# Altium schematic sheet Debugging LED.SchDoc
size A; SheetNumber: 5; SheetTotal: 9
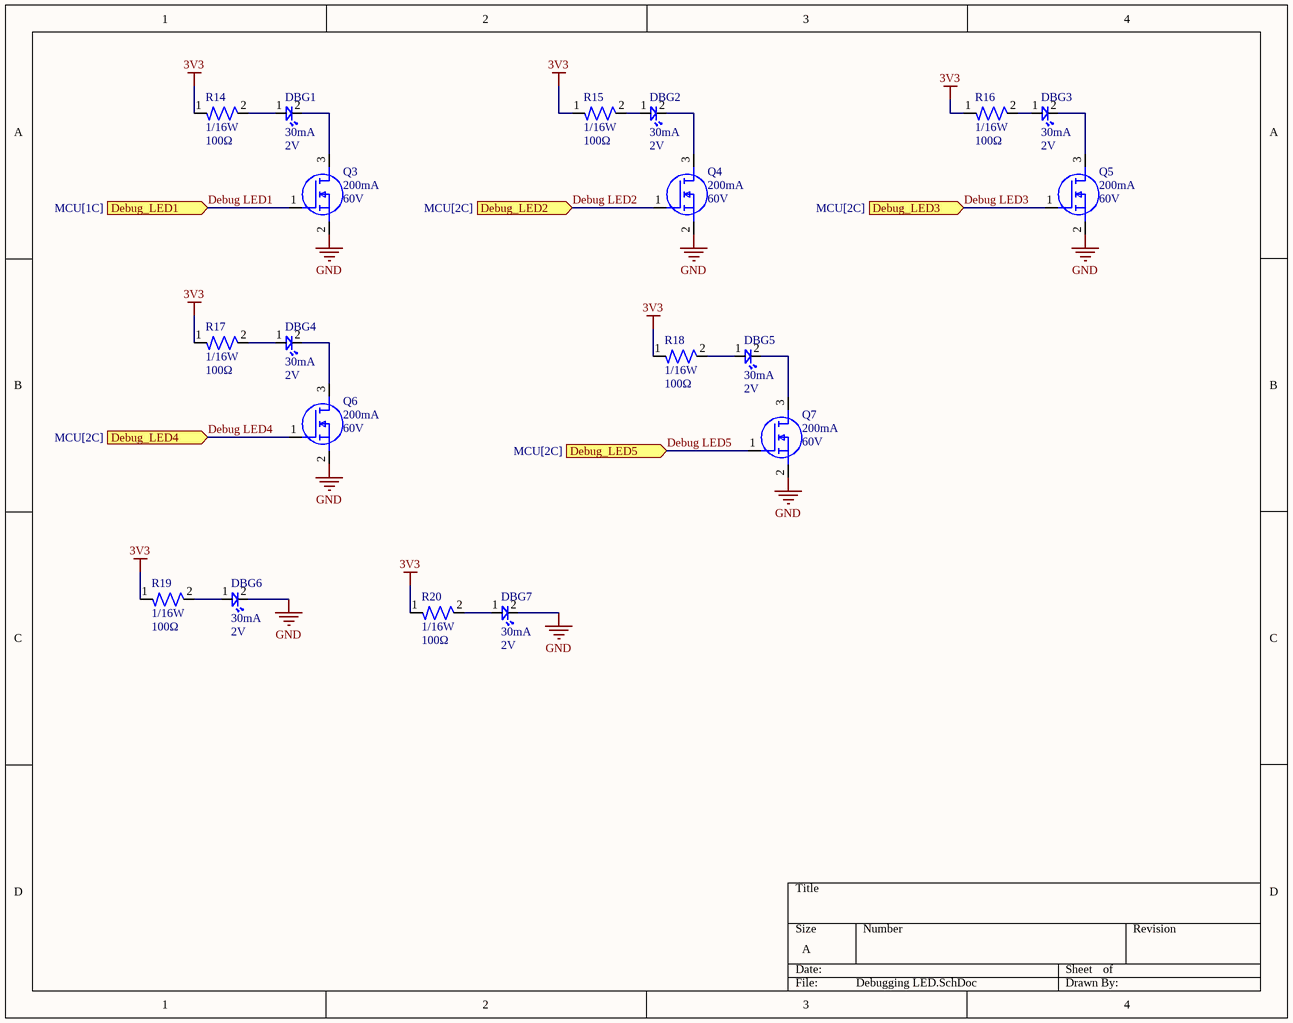
[diagram p0: Debugging LED.SchDoc]

## Parts
DBG1  Forward Current: 30mA  Forward Voltage: 2V  [LED-0603]  (hidden comment: BL-HKC36G-AV-TRB)
DBG2  Forward Current: 30mA  Forward Voltage: 2V  [LED-0603]  (hidden comment: BL-HKC36G-AV-TRB)
DBG3  Forward Current: 30mA  Forward Voltage: 2V  [LED-0603]  (hidden comment: BL-HKC36G-AV-TRB)
DBG4  Forward Current: 30mA  Forward Voltage: 2V  [LED-0603]  (hidden comment: BL-HKC36G-AV-TRB)
DBG5  Forward Current: 30mA  Forward Voltage: 2V  [LED-0603]  (hidden comment: BL-HKC36G-AV-TRB)
DBG6  Forward Current: 30mA  Forward Voltage: 2V  [LED-0603]  (hidden comment: BL-HKC36G-AV-TRB)
DBG7  Forward Current: 30mA  Forward Voltage: 2V  [LED-0603]  (hidden comment: BL-HKC36G-AV-TRB)
Q3  Continuous Current: 200mA  Voltage: 60V  [IC-SOT23-3]  (hidden comment: T2N7002AK,LM)
Q4  Continuous Current: 200mA  Voltage: 60V  [IC-SOT23-3]  (hidden comment: T2N7002AK,LM)
Q5  Continuous Current: 200mA  Voltage: 60V  [IC-SOT23-3]  (hidden comment: T2N7002AK,LM)
Q6  Continuous Current: 200mA  Voltage: 60V  [IC-SOT23-3]  (hidden comment: T2N7002AK,LM)
Q7  Continuous Current: 200mA  Voltage: 60V  [IC-SOT23-3]  (hidden comment: T2N7002AK,LM)
R14  Wattage: 1/16W  Resistance: 100Ω  [RES-0603]  (hidden comment: RES 0603)
R15  Wattage: 1/16W  Resistance: 100Ω  [RES-0603]  (hidden comment: RES 0603)
R16  Wattage: 1/16W  Resistance: 100Ω  [RES-0603]  (hidden comment: RES 0603)
R17  Wattage: 1/16W  Resistance: 100Ω  [RES-0603]  (hidden comment: RES 0603)
R18  Wattage: 1/16W  Resistance: 100Ω  [RES-0603]  (hidden comment: RES 0603)
R19  Wattage: 1/16W  Resistance: 100Ω  [RES-0603]  (hidden comment: RES 0603)
R20  Wattage: 1/16W  Resistance: 100Ω  [RES-0603]  (hidden comment: RES 0603)

## Ports
Debug_LED1 (in, see MCU[1C]), Debug_LED2 (in, see MCU[2C]), Debug_LED3 (in, see MCU[2C]), Debug_LED4 (in, see MCU[2C]), Debug_LED5 (in, see MCU[2C])

## Nets
3V3: R14.1 R15.1 R16.1 R17.1 R18.1 R19.1 R20.1
GND: DBG6.2 DBG7.2 Q3.2(S) Q4.2(S) Q5.2(S) Q6.2(S) Q7.2(S)
Debug LED1: Q3.1(G) ; port Debug_LED1
Debug LED2: Q4.1(G) ; port Debug_LED2
Debug LED3: Q5.1(G) ; port Debug_LED3
Debug LED4: Q6.1(G) ; port Debug_LED4
Debug LED5: Q7.1(G) ; port Debug_LED5
NetDBG1_1: DBG1.1 R14.2
NetDBG1_2: DBG1.2 Q3.3(D)
NetDBG2_1: DBG2.1 R15.2
NetDBG2_2: DBG2.2 Q4.3(D)
NetDBG3_1: DBG3.1 R16.2
NetDBG3_2: DBG3.2 Q5.3(D)
NetDBG4_1: DBG4.1 R17.2
NetDBG4_2: DBG4.2 Q6.3(D)
NetDBG5_1: DBG5.1 R18.2
NetDBG5_2: DBG5.2 Q7.3(D)
NetDBG6_1: DBG6.1 R19.2
NetDBG7_1: DBG7.1 R20.2

## Library data of the parts
DBG1-DBG7 = LED-0001: LED YELLOW CLEAR 0603 SMD; ComponentLink1Description: Datasheet; ComponentLink1URL: https://www.americanbrightled.com/pdffiles/led-components/smt/BL-HKC36G-AV-TRB.pdf
Q3-Q7 = NMOS-200MA-0001: MOSFET N-CH 60V 200MA SOT23; ComponentLink1Description: Datasheet; ComponentLink1URL: https://toshiba.semicon-storage.com/info/T2N7002AK_datasheet_en_20150401.pdf?did=29712&prodName=T2N7002AK